# Altium project Ezlo-RF-Switch.PrjPcb
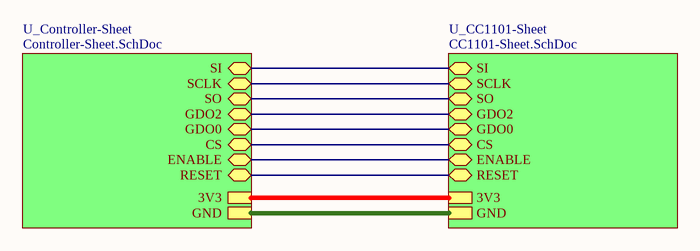
[diagram p0: Top-Sheet.SchDoc]
3 sheets, 29 parts. Net scope: hierarchical (ports join the sheet entries above them; power ports are global).
Sheets:
  Top-Sheet.SchDoc
    U_Controller-Sheet = Controller-Sheet.SchDoc
    U_CC1101-Sheet = CC1101-Sheet.SchDoc

## Sheet Top-Sheet.SchDoc
size A4; SheetNumber: 1; SheetTotal: 3

### Sub-sheets
U_CC1101-Sheet = CC1101-Sheet.SchDoc: SI (bidir), SCLK (bidir), SO (bidir), GDO2 (bidir), GDO0 (bidir), CS (bidir), ENABLE (bidir), RESET (bidir), 3V3, GND
U_Controller-Sheet = Controller-Sheet.SchDoc: SI (bidir), SCLK (bidir), SO (bidir), GDO2 (bidir), GDO0 (bidir), CS (bidir), ENABLE (bidir), RESET (bidir), 3V3, GND

### Nets
3V3: sheet U_Controller-Sheet/3V3, sheet U_CC1101-Sheet/3V3
GND: sheet U_Controller-Sheet/GND, sheet U_CC1101-Sheet/GND
CS: sheet U_Controller-Sheet/CS, sheet U_CC1101-Sheet/CS
ENABLE: sheet U_Controller-Sheet/ENABLE, sheet U_CC1101-Sheet/ENABLE
GDO0: sheet U_Controller-Sheet/GDO0, sheet U_CC1101-Sheet/GDO0
GDO2: sheet U_Controller-Sheet/GDO2, sheet U_CC1101-Sheet/GDO2
RESET: sheet U_Controller-Sheet/RESET, sheet U_CC1101-Sheet/RESET
SCLK: sheet U_Controller-Sheet/SCLK, sheet U_CC1101-Sheet/SCLK
SI: sheet U_Controller-Sheet/SI, sheet U_CC1101-Sheet/SI
SO: sheet U_Controller-Sheet/SO, sheet U_CC1101-Sheet/SO

### Notes on the sheet
- File:
- Title:
- Date:
- Page
- Num:
- Total:
- Drawn By: Huzaifa Ali

## Sheet Controller-Sheet.SchDoc
size A4; SheetNumber: 2; SheetTotal: 3
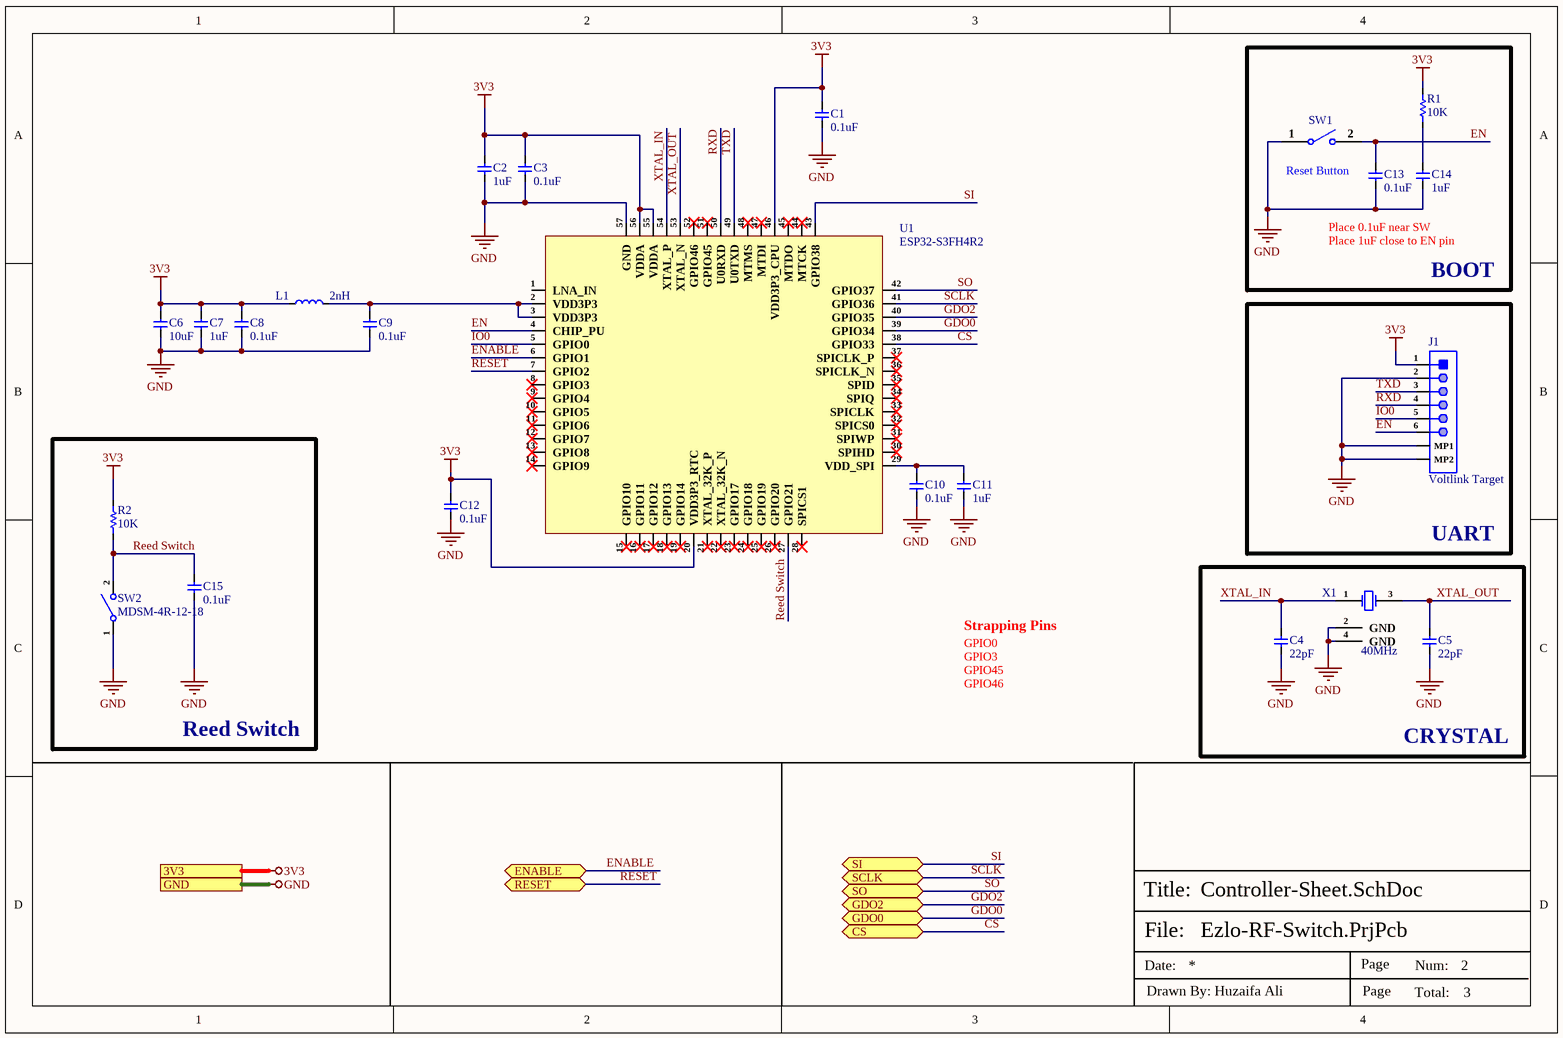
[diagram p1: Controller-Sheet.SchDoc]

### Parts
C1  0.1uF  [CAP-0201]
C2  1uF  [CAP-0201]
C3  0.1uF  [CAP-0201]
C4  22pF  [CAP-0201]
C5  22pF  [CAP-0201]
C6  10uF  [Cap-0603]
C7  1uF  [CAP-0201]
C8  0.1uF  [CAP-0201]
C9  0.1uF  [CAP-0201]
C10  0.1uF  [CAP-0201]
C11  1uF  [CAP-0201]
C12  0.1uF  [CAP-0201]
C13  0.1uF  [CAP-0201]
C14  1uF  [CAP-0201]
C15  0.1uF  [CAP-0201]
J1  Voltlink Target  [Voltlink Target]
L1  2nH  [IND-0201]
R1  10K  [Res-0201]
R2  10K  [Res-0201]
SW1  B3U-1000P  [B3U-1000P]  (value not drawn)
SW2  MDSM-4R-12-18  [MDSM-4R-12-18]
U1  ESP32-S3FH4R2  [QFNWB-56 (7×7)]
X1  40MHz  [X322540MPB4SI_]

### Blocks framed on the sheet
BOOT: C13 C14 R1 SW1
UART: J1
Reed Switch: C15 R2 SW2
CRYSTAL: C4 C5 X1

### Ports
3V3 (see Top-Sheet[2C], CC1101-Sheet[1D]), CS (bidir, see Top-Sheet[2B], CC1101-Sheet[3D]), ENABLE (bidir, see Top-Sheet[2B], CC1101-Sheet[2D]), GDO0 (bidir, see Top-Sheet[2B], CC1101-Sheet[3D]), GDO2 (bidir, see Top-Sheet[2B], CC1101-Sheet[3D]), GND (see Top-Sheet[2C], CC1101-Sheet[1D]), RESET (bidir, see Top-Sheet[2B], CC1101-Sheet[2D]), SCLK (bidir, see Top-Sheet[2B], CC1101-Sheet[3D]), SI (bidir, see Top-Sheet[2B], CC1101-Sheet[3D]), SO (bidir, see Top-Sheet[2B], CC1101-Sheet[3D])

### Nets
3V3: C1.2 C2.2 C3.2 C6.2 C7.2 C8.2 C12.2 J1.1 L1.1 R1.2 R2.2 U1.20(VDD3P3_RTC) U1.46(VDD3P3_CPU) U1.55(VDDA) U1.56(VDDA) ; port 3V3
GND: C1.1 C2.1 C3.1 C4.1 C5.1 C6.1 C7.1 C8.1 C9.1 C10.1 C11.1 C12.1 C13.1 C14.1 C15.1 J1.2 J1.MP1 J1.MP2 SW1.1 SW2.1 U1.57(GND) X1.2(GND) X1.4(GND) ; port GND
CS: U1.38(GPIO33) ; port CS
EN: C13.2 J1.6 SW1.2 U1.4(CHIP_PU)
ENABLE: U1.6(GPIO1) ; port ENABLE
GDO0: U1.39(GPIO34) ; port GDO0
GDO2: U1.40(GPIO35) ; port GDO2
IO0: J1.5 U1.5(GPIO0)
Reed Switch: C15.2 R2.1 SW2.2 U1.27(GPIO21)
RESET: U1.7(GPIO2) ; port RESET
RXD: J1.4 U1.50(U0RXD)
SCLK: U1.41(GPIO36) ; port SCLK
SI: U1.43(GPIO38) ; port SI
SO: U1.42(GPIO37) ; port SO
TXD: J1.3 U1.49(U0TXD)
XTAL_IN: C4.2 U1.54(XTAL_P) X1.1(CRYSTAL)
XTAL_OUT: C5.2 U1.53(XTAL_N) X1.3(CRYSTAL)
NetC9_2: C9.2 L1.2 U1.2(VDD3P3) U1.3(VDD3P3)
NetC10_2: C10.2 C11.2 U1.29(VDD_SPI)
NetC14_2: C14.2 R1.1

Not connected (* = marked no-connect by the designer): U1 1(LNA_IN) 8(GPIO3)* 9(GPIO4)* 10(GPIO5)* 11(GPIO6)* 12(GPIO7)* 13(GPIO8)* 14(GPIO9)* 15(GPIO10)* 16(GPIO11)* 17(GPIO12)* 18(GPIO13)* 19(GPIO14)* 21(XTAL_32K_P)* 22(XTAL_32K_N)* 23(GPIO17)* 24(GPIO18)* 25(GPIO19)* 26(GPIO20)* 28(SPICS1)* 30(SPIHD)* 31(SPIWP)* 32(SPICS0)* 33(SPICLK)* 34(SPIQ)* 35(SPID)* 36(SPICLK_N)* 37(SPICLK_P)* 44(MTCK)* 45(MTDO)* 47(MTDI)* 48(MTMS)* 51(GPIO45)* 52(GPIO46)*

### Notes on the sheet
- Reset Button
- Place 1uF close to EN pin
- Place 0.1uF near SW
- Strapping Pins
- GPIO0
  GPIO3
  GPIO45
  GPIO46
- File:
- Title:
- Date:
- Page
- Num:
- Total:
- Drawn By: Huzaifa Ali

### Library data of the parts
C1 C3 C8-C10 C12 C13 C15 = GRM033R61E104KE14D: CAP CER 0.1UF 25V X5R 0201; Manufacturer: Murata; Tolerance: 10%; Item Type: Capacitor; Material: 4241ConductorMaterial; Value: 100nF; Manufacturer Part Number: GRM033R61E104KE14D; RoHS: Yes; Category: Ceramic Capacitors; Case/Package: 0201; Case Code (Metric): 0603; Case Code (Imperial): 0201; Weight: 1.2E-05oz; Min Operating Temperature: -55°C; Max Operating Temperature: 85°C; Packaging: Tape and Reel; Voltage Rating: 25V; Dielectric: X5R; Termination: SMD/SMT; Voltage Rating (DC): 25V; Package Quantity: 15000; Series: GRM; Length: 0.024inch; Width: 0.012inch; Height: 0.3mm; Thickness: 0.013inch; Lead Free: Lead Free; RoHS Compliant: Yes; ComponentLink1URL: http://www.farnell.com/datasheets/2867843.pdf?src-supplier=Farnell; ComponentLink1Description: http://www.farnell.com/datasheets/2867843.pdf?src-supplier=Farnell; ComponentLink2URL: http://www.mouser.com/ds/2/281/c02e-2905.pdf?src-supplier=Mouser; ComponentLink2Description: http://www.mouser.com/ds/2/281/c02e-2905.pdf?src-supplier=Mouser; ComponentLink3URL: https://datasheet.octopart.com/GRM033R61E104KE14D-Murata-datasheet-22122223.pdf?src-supplier=Future+Electronics; ComponentLink3Description: https://datasheet.octopart.com/GRM033R61E104KE14D-Murata-datasheet-22122223.pdf?src-supplier=Future+Electronics; ComponentLink4URL: http://www.farnell.com/datasheets/2867843.pdf?src-supplier=Element14; ComponentLink4Description: http://www.farnell.com/datasheets/2867843.pdf?src-supplier=Element14; ComponentLink5URL: http://search.murata.co.jp/Ceramy/image/img/A01X/G101/ENG/GRM033R61E104KE14-01.pdf?src-supplier=Digi-Key; ComponentLink5Description: http://search.murata.co.jp/Ceramy/image/img/A01X/G101/ENG/GRM033R61E104KE14-01.pdf?src-supplier=Digi-Key; LCSC Part Number: C76939; Supplier: Rs; Supplier Part Number: 1852066; Stock: 14000; Pricing: 1000=0.008, 5000=0.007, 10000=0.006 (GBP); Mounting Technology: Surface Mount; ComponentLink6URL: http://www.farnell.com/datasheets/2867843.pdf?src-supplier=Newark; ComponentLink6Description: http://www.farnell.com/datasheets/2867843.pdf?src-supplier=Newark; ComponentLink7URL: https://datasheet.octopart.com/GRM033R61E104KE14D-Murata-datasheet-165579666.pdf?src-supplier=TME; ComponentLink7Description: https://datasheet.octopart.com/GRM033R61E104KE14D-Murata-datasheet-165579666.pdf?src-supplier=TME
C2 C7 C11 C14 = GRM033R61C105ME15D: CAP CER 1UF 16V X5R 0201; Manufacturer: Murata; Item Type: Capacitor; Supplier 1: Digi-Key; Manufacturer Part Number: GRM033R61C105ME15D; Stock 1: 12823; Pricing 1: 1=0.14, 10=0.098, 50=0.0554, 100=0.0459, 500=0.0322, 1000=0.02665, 2500=0.02481, 5000=0.0227 (USD); ComponentLink1URL: https://datasheet.octopart.com/GRM033R61C105ME15D-Murata-datasheet-155345049.pdf?src-supplier=Element14; ComponentLink1Description: https://datasheet.octopart.com/GRM033R61C105ME15D-Murata-datasheet-155345049.pdf?src-supplier=Element14; Supplier Part Number 1: 490-18654-1-ND; LCSC Part Number: C335102; RoHS: No; Category: Ceramic Capacitors; ComponentLink2URL: https://datasheet.octopart.com/GRM033R61C105ME15D-Murata-datasheet-165579666.pdf?src-supplier=TME; ComponentLink2Description: https://datasheet.octopart.com/GRM033R61C105ME15D-Murata-datasheet-165579666.pdf?src-supplier=TME
C4 C5 = GRM0335C1H220JA01D: CAP CER 22PF 50V C0G/NP0 0201; Manufacturer: Murata; Tolerance: 5%; Dielectric: C0G; Temperature Coefficient: 30ppm/°C; Item Type: Capacitor; Material: 4241ConductorMaterial; Manufacturer Part Number: GRM0335C1H220JA01D; RoHS: Yes; Category: Ceramic Capacitors; Mounting Technology: Surface Mount; Case/Package: 0201; Case Code (Metric): 0603; Case Code (Imperial): 0201; Min Operating Temperature: -55°C; Max Operating Temperature: 125°C; Value: 22pF; Voltage Rating: 50V; Packaging: Tape and Reel; Package Quantity: 1; Voltage Rating (DC): 50V; Termination: SMD/SMT; Voltage: 50V; Series: GRM; Length: 0.024inch; Width: 0.012inch; Height: 0.3mm; Depth: 0.3mm; Lead Free: Lead Free; RoHS Compliant: Yes; ComponentLink1URL: https://datasheet.ciiva.com/6271/partnumbering-e-01-6271146.pdf?src-supplier=Digi-Key; ComponentLink1Description: https://datasheet.ciiva.com/6271/partnumbering-e-01-6271146.pdf?src-supplier=Digi-Key; ComponentLink2URL: https://datasheet.ciiva.com/6271/partnumbering-e-01-6271143.pdf?src-supplier=Digi-Key; ComponentLink2Description: https://datasheet.ciiva.com/6271/partnumbering-e-01-6271143.pdf?src-supplier=Digi-Key; ComponentLink3URL: https://datasheet.ciiva.com/6271/partnumbering-e-01-6271149.pdf?src-supplier=Digi-Key; ComponentLink3Description: https://datasheet.ciiva.com/6271/partnumbering-e-01-6271149.pdf?src-supplier=Digi-Key; LCSC Part Number: C76924; Supplier: Rs; Supplier Part Number: 8202728; Stock: 9500; Pricing: 500=0.004, 5000=0.003, 12500=0.002, 50000=0.002 (GBP)
C6 = GRM188R6YA106MA73D: 10uF 35V X5R 20% Pad SMD 0603; Manufacturer: Murata; Supplier 1: Arrow Electronics; Manufacturer Part Number: GRM188R6YA106MA73D; RoHS: Yes; Category: Ceramic Capacitors; Stock 1: 37601; Pricing 1: 1=0.36650, 10=0.23380, 25=0.23160, 100=0.15050, 250=0.14890, 500=0.10700, 1000=0.09270, 3000=0.08640, 6000=0.07720, 15000=0.07140, 30000=0.05840 (USD); Mount: Surface Mount; Case/Package: 0603; Case Code (Metric): 1608; Case Code (Imperial): 0603; Min Operating Temperature: -55°C; Max Operating Temperature: 85°C; Packaging: Tape and Reel; Capacitance: 10uF; Voltage Rating: 35V; Tolerance: 20%; Voltage Rating (DC): 35V; Dielectric: X5R; Length: 0.063inch; Width: 0.031inch; Thickness: 0.039inch; RoHS Compliant: Yes; ComponentLink1URL: http://search.murata.co.jp/Ceramy/image/img/A01X/G101/ENG/GRM188R6YA106MA73-01.pdf?src-supplier=Future+Electronics; ComponentLink1Description: http://search.murata.co.jp/Ceramy/image/img/A01X/G101/ENG/GRM188R6YA106MA73-01.pdf?src-supplier=Future+Electronics; ComponentLink2URL: http://search.murata.co.jp/Ceramy/image/img/A01X/G101/ENG/GRM188R6YA106MA73-01.pdf?src-supplier=Digi-Key; ComponentLink2Description: http://search.murata.co.jp/Ceramy/image/img/A01X/G101/ENG/GRM188R6YA106MA73-01.pdf?src-supplier=Digi-Key; ComponentLink3URL: https://www.murata.com/~/media/webrenewal/support/library/catalog/products/capacitor/mlcc/c02e.ashx?la=en-us&src-supplier=Digi-Key; ComponentLink3Description: https://www.murata.com/~/media/webrenewal/support/library/catalog/products/capacitor/mlcc/c02e.ashx?la=en-us&src-supplier=Digi-Key; ComponentLink4URL: http://search.murata.co.jp/Ceramy/image/img/A01X/G101/ENG/GRM188R6YA106MA73-01.pdf?src-supplier=Mouser; ComponentLink4Description: http://search.murata.co.jp/Ceramy/image/img/A01X/G101/ENG/GRM188R6YA106MA73-01.pdf?src-supplier=Mouser; ComponentLink5URL: http://search.murata.co.jp/Ceramy/image/img/A01X/G101/ENG/GRM188R6YA106MA73-01.pdf?src-supplier=TTI; ComponentLink5Description: http://search.murata.co.jp/Ceramy/image/img/A01X/G101/ENG/GRM188R6YA106MA73-01.pdf?src-supplier=TTI; Supplier Part Number 1: GRM188R6YA106MA73D; LCSC Part Number: C194427
J1 = C145963: 1x6P SH 1 1mm 6 SMD,P=1mm Wire To Board / Wire To Wire Connector ROHS; Manufacturer: BOOMELE; Manufacturer Part Number: C145963; Package: SMD,P=1mm; LCSC Part Number: C145963; Item Type: Connector; ComponentLink1Description: LCSC; ComponentLink1URL: https://www.lcsc.com/product-detail/Wire-To-Board-Wire-To-Wire-Connector_BOOMELE-Boom-Precision-Elec-C145963_C145963.html
L1 = MLG0603P2N0CT000: FIXED IND 2NH 600MA 100 MOHM SMD; Manufacturer: TDK; Item Type: Inductor; Core Material: Non-Magnetic; Shielding: Unshielded; DC Resistance (DCR): 100mR; Self Resonant Frequency: 8.5GHz; Test Frequency: 500MHz; Supplier: Digi-Key; Supplier Part Number: 445-172431-1-ND; Manufacturer Part Number: MLG0603P2N0CT000; RoHS: Yes; Category: Fixed Inductors; Stock: 23499; Pricing: 1=0.13, 10=0.118, 25=0.1, 50=0.0882, 100=0.0808, 250=0.07352, 500=0.06908, 1000=0.05292, 2500=0.04998 (USD); ComponentLink1URL: https://datasheet.ciiva.com/41860/inductor-commercial-high-frequency-mlg-qp-en-41860968.pdf?src-supplier=Digi-Key; ComponentLink1Description: https://datasheet.ciiva.com/41860/inductor-commercial-high-frequency-mlg-qp-en-41860968.pdf?src-supplier=Digi-Key; LCSC Part Number: C531323; Mounting Technology: Surface Mount; Case/Package: 0201; Case Code (Metric): 0603; Case Code (Imperial): 0201; Min Operating Temperature: -55°C; Max Operating Temperature: 125°C; Package Quantity: 15000; Packaging: Cut Tape; Current Rating: 600mA; Value: 2nH; Series: MLG-P; Length: 0.024inch; Width: 0.012inch; Height - Seated (Max): 0.013inch; RoHS Compliant: Yes
R1 R2 = RC0201FR-0710KL: RES SMD 10K OHM 1% 1/20W 0201; Manufacturer: Yageo; Item Type: Resistor; Manufacturer Part Number: RC0201FR-0710KL; Package: 0201; ComponentLink7Description: LCSC; ComponentLink7URL: https://www.lcsc.com/product-detail/Chip-Resistor-Surface-Mount_YAGEO-RC0201FR-0710KL_C106225.html; LCSC Part Number: C106225
SW1 = B3U-1000P: SWITCH TACTILE SPST-NO 0.05A 12V; Manufacturer: Omron; Mechanical Life: 200000Cycles; Operating Force: 1.5N; Throw Configuration: SPST; Current Rating: 50mA; Contact Resistance: 100mR; Illumination Type: Non-Illuminated,Illuminated; Switch Travel: 0.15mm; Switch Function: Off-Mom; Actuator Type: Standard; Actuator Length: 0.4mm; Ratings: Dust Proof,IP40; ComponentLink1URL: http://www.farnell.com/datasheets/60838.pdf?src-supplier=Farnell; ComponentLink1Description: http://www.farnell.com/datasheets/60838.pdf?src-supplier=Farnell; ComponentLink2URL: http://www.farnell.com/datasheets/60838.pdf?src-supplier=Element14; ComponentLink2Description: http://www.farnell.com/datasheets/60838.pdf?src-supplier=Element14; ComponentLink3URL: https://omronfs.omron.com/en_US/ecb/products/pdf/en-b3u.pdf?src-supplier=Digi-Key; ComponentLink3Description: https://omronfs.omron.com/en_US/ecb/products/pdf/en-b3u.pdf?src-supplier=Digi-Key; ComponentLink4URL: http://www.omron.com/ecb/products/pdf/en-b3u.pdf?src-supplier=Digi-Key; ComponentLink4Description: http://www.omron.com/ecb/products/pdf/en-b3u.pdf?src-supplier=Digi-Key; ComponentLink5URL: https://www.distrelec.biz/Web/Downloads/he/et/B3U_eng_datasheet.pdf?mime=application%2Fpdf&src-supplier=Distrelec; ComponentLink5Description: https://www.distrelec.biz/Web/Downloads/he/et/B3U_eng_datasheet.pdf?mime=application%2Fpdf&src-supplier=Distrelec; ComponentLink6URL: http://www.onlinecomponents.com/productFiles/mf-OM/en-b3u.pdf?src-supplier=Onlinecomponents.com; ComponentLink6Description: http://www.onlinecomponents.com/productFiles/mf-OM/en-b3u.pdf?src-supplier=Onlinecomponents.com; Supplier 1: Digi-Key; Manufacturer Part Number: B3U-1000P; Stock 1: 116454; Pricing 1: 1=1, 10=0.961, 25=0.9064, 50=0.7976, 100=0.7251, 250=0.68888, 500=0.67074, 1000=0.52571 (USD); Mount: Surface Mount; Weight: 0.000776oz; Contact Material: Silver; Min Operating Temperature: -25°C; Max Operating Temperature: 70°C; Packaging: Tape and Reel; Voltage Rating (DC): 12V; Package Quantity: 1; Max Current Rating: 50mA; Termination: SMD/SMT; Orientation: Straight; Max Voltage Rating (DC): 12V; Electrical Life: 200000Cycles; Insulation Resistance: 100MR; Contact Current Rating: 50mA; Length: 4mm; Height: 1.2mm; Depth: 2.5mm; Width: 3mm; REACH SVHC: Unknown; Lead Free: Lead Free; ComponentLink7URL: https://www.verical.com/server-webapp/html/getDatasheet?partID=552554&src-supplier=Verical; ComponentLink7Description: https://www.verical.com/server-webapp/html/getDatasheet?partID=552554&src-supplier=Verical; ComponentLink8URL: http://www.farnell.com/datasheets/1685550.pdf?src-supplier=Element14; ComponentLink8Description: http://www.farnell.com/datasheets/1685550.pdf?src-supplier=Element14; ComponentLink9URL: http://www.farnell.com/datasheets/2610940.pdf?src-supplier=Farnell; ComponentLink9Description: http://www.farnell.com/datasheets/2610940.pdf?src-supplier=Farnell; ComponentLink10URL: https://www.alliedelec.com/m/d/4c8a9ef82804fc3c241a13c1e298fd73.pdf?src-supplier=Allied+Electronics; ComponentLink10Description: https://www.alliedelec.com/m/d/4c8a9ef82804fc3c241a13c1e298fd73.pdf?src-supplier=Allied+Electronics; Supplier Part Number 1: SW1020DKR-ND; LCSC Part Number: C231329; Item Type: Switch
SW2 = MDSM-4R-12-18: SWITCH REED SPST-NO 350MA 140V; Manufacturer: Littelfuse; Contact Current Rating: 500mA; Supplier: Digi-Key; Supplier Part Number: HE151CT-ND; Manufacturer Part Number: MDSM-4R-12-18; RoHS: Yes; Category: Switches; Stock: 229031; Pricing: 1=0.97, 10=0.932, 25=0.8712, 100=0.7565, 250=0.6884, 500=0.6603 (USD); Pins: 2NUMBER; Height: 2.84mm; ComponentLink1URL: https://datasheet.ciiva.com/26852/getdatasheetpartid-422080-26852456.pdf?src-supplier=Verical; ComponentLink1Description: https://datasheet.ciiva.com/26852/getdatasheetpartid-422080-26852456.pdf?src-supplier=Verical; ComponentLink2URL: https://datasheet.ciiva.com/16451/mdsm-4-16451549.pdf?src-supplier=Future+Electronics; ComponentLink2Description: https://datasheet.ciiva.com/16451/mdsm-4-16451549.pdf?src-supplier=Future+Electronics; ComponentLink3URL: https://datasheet.ciiva.com/29124/mdsm-4r-29124540.pdf?src-supplier=Digi-Key; ComponentLink3Description: https://datasheet.ciiva.com/29124/mdsm-4r-29124540.pdf?src-supplier=Digi-Key; ComponentLink4URL: https://datasheet.ciiva.com/29124/mdsm-4r-29124541.pdf?src-supplier=Digi-Key; ComponentLink4Description: https://datasheet.ciiva.com/29124/mdsm-4r-29124541.pdf?src-supplier=Digi-Key; ComponentLink5URL: https://datasheet.ciiva.com/29124/mdsm-4r-29124542.pdf?src-supplier=Digi-Key; ComponentLink5Description: https://datasheet.ciiva.com/29124/mdsm-4r-29124542.pdf?src-supplier=Digi-Key
U1 = ESP32-S3FH4R2: 21dBm ESP32-S3R8 2.4GHz SMD WiFi Modules ROHS; Manufacturer: Espressif Systems; Item Type: IC; Supplier: Mouser; Supplier Part Number: 356-ESP32-S3FH4R2; Manufacturer Part Number: ESP32-S3FH4R2; RoHS: No; Stock: 2650; Pricing: 1=2.32, 10=2.32, 50=2.32, 100=2.32, 1000=2.32, 10000=2.32 (USD); LCSC Part Number: C3013940; ComponentLink1Description: LCSC; ComponentLink1URL: https://www.lcsc.com/product-detail/WiFi-Modules_Espressif-Systems-ESP32-S3FH4R2_C3013940.html
X1 = X322540MPB4SI: 40MHz SMD Crystal Resonator 15pF SMD3225-4P Crystals ROHS; Manufacturer: Yangxing Tech; Manufacturer Part Number: X322540MPB4SI; Value: 40MHZ; LCSC Part Number: C9010; ComponentLink1Description: LCSC; ComponentLink1URL: https://www.lcsc.com/product-detail/Crystals_Yangxing-Tech-X322540MPB4SI_C9010.html; Item Type: Crystal

## Sheet CC1101-Sheet.SchDoc
size A4; SheetNumber: 3; SheetTotal: 3
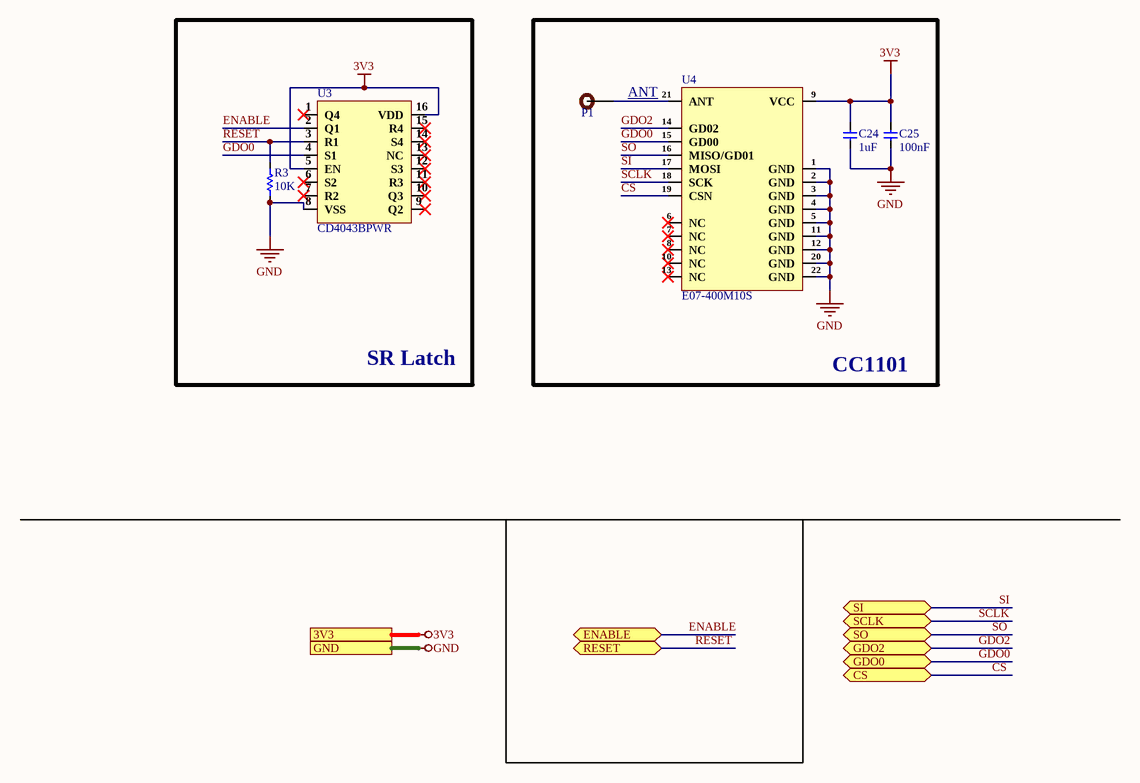
[diagram p2: CC1101-Sheet.SchDoc]

### Parts
C24  1uF  [Cap-0201]
C25  100nF  [Cap-0201]
P1  TEST POINT  [Test-point]  (value not drawn)
R3  10K  [Res-0201]
U3  CD4043BPWR  [TSSOP_16]
U4  E07-400M10S  [E07-400M10S]

### Blocks framed on the sheet
SR Latch: R3 U3
CC1101: C24 C25 P1 U4

### Ports
3V3 (see Top-Sheet[2C], Controller-Sheet[1D]), CS (bidir, see Top-Sheet[2B], Controller-Sheet[3D]), ENABLE (bidir, see Top-Sheet[2B], Controller-Sheet[2D]), GDO0 (bidir, see Top-Sheet[2B], Controller-Sheet[3D]), GDO2 (bidir, see Top-Sheet[2B], Controller-Sheet[3D]), GND (see Top-Sheet[2C], Controller-Sheet[1D]), RESET (bidir, see Top-Sheet[2B], Controller-Sheet[2D]), SCLK (bidir, see Top-Sheet[2B], Controller-Sheet[3D]), SI (bidir, see Top-Sheet[2B], Controller-Sheet[3D]), SO (bidir, see Top-Sheet[2B], Controller-Sheet[3D])

### Nets
3V3: C24.2 C25.2 U3.5(EN) U3.16(VDD) U4.9(VCC) ; port 3V3
GND: C24.1 C25.1 R3.1 U3.8(VSS) U4.1(GND) U4.2(GND) U4.3(GND) U4.4(GND) U4.5(GND) U4.11(GND) U4.12(GND) U4.20(GND) U4.22(GND) ; port GND
CS: U4.19(CSN) ; port CS
ENABLE: U3.2(Q1) ; port ENABLE
GDO0: U3.4(S1) U4.15(GD00) ; port GDO0
GDO2: U4.14(GD02) ; port GDO2
RESET: R3.2 U3.3(R1) ; port RESET
SCLK: U4.18(SCK) ; port SCLK
SI: U4.17(MOSI) ; port SI
SO: U4.16(MISO/GD01) ; port SO
NetP1_1: P1.1 U4.21(ANT)

Not connected (* = marked no-connect by the designer): U3 1(Q4)* 6(S2)* 7(R2)* 9(Q2)* 10(Q3)* 11(R3)* 12(S3)* 13(NC)* 14(S4)* 15(R4)*; U4 6(NC)* 7(NC)* 8(NC)* 10(NC)* 13(NC)*

### Notes on the sheet
- ANT <Add 10pF cap here>
- File:
- Title:
- Date:
- Page
- Num:
- Total:
- Drawn By: Huzaifa Ali

### Library data of the parts
C24 = CC0201KRX5R5BB105: CAP CER 1UF 6.3V X5R 0201; Manufacturer: Yageo; Tolerance: 10%; Item Type: Capacitor; Supplier 1: Arrow Electronics; Manufacturer Part Number: CC0201KRX5R5BB105; RoHS: Yes; Category: Ceramic Capacitors; Stock 1: 600000; Pricing 1: 15000=0.00740 (USD); Mount: Surface Mount; Case/Package: 0201; Case Code (Imperial): 0201; Case Code (Metric): 0603; Min Operating Temperature: -55°C; Max Operating Temperature: 85°C; Packaging: Cut Tape; Capacitance: 1uF; Voltage Rating: 6.3V; RoHS Compliant: Yes; ComponentLink1URL: http://www.yageo.com/documents/recent/UPY-GPHC_X5R_4V-to-50V_25.pdf?src-supplier=Digi-Key; ComponentLink1Description: http://www.yageo.com/documents/recent/UPY-GPHC_X5R_4V-to-50V_25.pdf?src-supplier=Digi-Key; ComponentLink2URL: https://www.yageo.com/upload/media/product/productsearch/datasheet/mlcc/UPY-GPHC_X5R_4V-to-50V_26.pdf?src-supplier=Digi-Key; ComponentLink2Description: https://www.yageo.com/upload/media/product/productsearch/datasheet/mlcc/UPY-GPHC_X5R_4V-to-50V_26.pdf?src-supplier=Digi-Key; Supplier Part Number 1: CC0201KRX5R5BB105; LCSC Part Number: C541330
C25 = CC0201KRX5R5BB104: CAP CER 0.1UF 6.3V X5R 0201; Manufacturer: Yageo; Tolerance: 10%; Supplier 1: Avnet; Manufacturer Part Number: CC0201KRX5R5BB104; RoHS: Yes; Category: Ceramic Capacitors; Stock 1: 1290000; Pricing 1: 15000=0.00238 (USD); Mount: Surface Mount; Case/Package: 0201; Number of Pins: 2; Case Code (Imperial): 0201; Case Code (Metric): 0603; Min Operating Temperature: -55°C; Max Operating Temperature: 85°C; Capacitance: 100nF; Dielectric: X5R; Voltage Rating: 6.3V; Packaging: Tape and Reel; Package Quantity: 1; Voltage Rating (DC): 6.3V; Termination: SMD/SMT; Resistor Type: Ceramic; Series: CC; Length: 0.6mm; Width: 0.012inch; Height: 0.3mm; Thickness: 0.013inch; Depth: 0.3mm; Reach SVHC Compliant: Yes; Lead Free: Lead Free; Halogen Free: Halogen Free; RoHS Compliant: Yes; ComponentLink1URL: https://datasheet.ciiva.com/7656/1525783-7656597.pdf?src-supplier=Element14; ComponentLink1Description: https://datasheet.ciiva.com/7656/1525783-7656597.pdf?src-supplier=Element14; ComponentLink2URL: https://datasheet.ciiva.com/28450/1359354-28450200.pdf?src-supplier=Element14; ComponentLink2Description: https://datasheet.ciiva.com/28450/1359354-28450200.pdf?src-supplier=Element14; ComponentLink3URL: https://datasheet.ciiva.com/176/mlccorderingcode-176766.pdf?src-supplier=Digi-Key; ComponentLink3Description: https://datasheet.ciiva.com/176/mlccorderingcode-176766.pdf?src-supplier=Digi-Key; ComponentLink4URL: https://datasheet.ciiva.com/176/mlccorderingcode-176765.pdf?src-supplier=Digi-Key; ComponentLink4Description: https://datasheet.ciiva.com/176/mlccorderingcode-176765.pdf?src-supplier=Digi-Key; ComponentLink5URL: https://datasheet.ciiva.com/176/mlccorderingcode-176767.pdf?src-supplier=Digi-Key; ComponentLink5Description: https://datasheet.ciiva.com/176/mlccorderingcode-176767.pdf?src-supplier=Digi-Key; Supplier Part Number 1: CC0201KRX5R5BB104
P1 = TEST POINT: Test Point ON; Item Type: TEST POINT
R3 = RC0201JR-0710KL: RES SMD 10K OHM 5% 1/20W 0201; Manufacturer: Yageo; Voltage Rating (DC): 25V; Power Rating: 50mW; Resistance: 10kR; Temperature Coefficient: 200ppm/°C; Case Code (Imperial): 0201; Case Code (Metric): 0603; Case/Package: 0201; Category: Chip SMD Resistors; Contact Plating: Tin,Matte; Depth: 0.3mm; Lead Free: Lead Free; Length: 0.6mm; Manufacturer Part Number: RC0201JR-0710KL; Max Operating Temperature: 125°C; Military Standard: Not; Min Operating Temperature: -55°C; Packaging: Tape and Reel; Radiation Hardening: No; REACH SVHC: Unknown; Resistor Type: Thick Film; Termination: SMD/SMT; Tolerance: 5%; Voltage Rating: 25V; ComponentLink1Description: New link; ComponentLink1URL: *; Supplier 1: Digi-Key; RoHS: Yes; Stock 1: 1488597; Pricing 1: 1=0.10000, 10=0.02600, 100=0.01050, 1000=0.00472, 2500=0.00410, 5000=0.00338 (USD); ComponentLink2URL: https://datasheet.ciiva.com/8891/pyu-rc0201-51-rohs-l-8-8891388.pdf?src-supplier=Avnet; ComponentLink2Description: https://datasheet.ciiva.com/8891/pyu-rc0201-51-rohs-l-8-8891388.pdf?src-supplier=Avnet; ComponentLink3URL: https://datasheet.ciiva.com/7672/1563626-7672253.pdf?src-supplier=Element14; ComponentLink3Description: https://datasheet.ciiva.com/7672/1563626-7672253.pdf?src-supplier=Element14; ComponentLink4URL: https://datasheet.ciiva.com/28405/pyu-rc0201-51-rohs-l-8-28405613.pdf?src-supplier=Avnet+Europe; ComponentLink4Description: https://datasheet.ciiva.com/28405/pyu-rc0201-51-rohs-l-8-28405613.pdf?src-supplier=Avnet+Europe; ComponentLink5URL: https://datasheet.ciiva.com/7672/1563626-7672254.pdf?src-supplier=Element14; ComponentLink5Description: https://datasheet.ciiva.com/7672/1563626-7672254.pdf?src-supplier=Element14; ComponentLink6URL: https://datasheet.ciiva.com/7660/1421516-7660810.pdf?src-supplier=Element14; ComponentLink6Description: https://datasheet.ciiva.com/7660/1421516-7660810.pdf?src-supplier=Element14; ComponentLink7URL: https://datasheet.ciiva.com/16856/pyu-rc0201-51-rohs-l-8-16856011.pdf?src-supplier=Avnet+Europe; ComponentLink7Description: https://datasheet.ciiva.com/16856/pyu-rc0201-51-rohs-l-8-16856011.pdf?src-supplier=Avnet+Europe; ComponentLink8URL: https://datasheet.ciiva.com/46391/1421516-46391291.pdf?src-supplier=Element14; ComponentLink8Description: https://datasheet.ciiva.com/46391/1421516-46391291.pdf?src-supplier=Element14; Supplier Part Number 1: 311-10KNCT-ND; LCSC Part Number: C138117
U3 = CD4043BPWR: 16-Bit Transparent D-Type Latch With 3-State Outputs 48-TVSOP -40 to 125; Manufacturer: Texas Instruments; Manufacturer Part Number: SN74LVC16373ADGVR; Item Type: IC; Supplier: Digi-Key; Supplier Part Number: 296-13242-1-ND; RoHS: Yes; Category: Latches and Flip Flops; Stock: 4536; Pricing: 1=1.51, 10=1.353, 25=1.284, 100=1.0546, 250=0.98588, 500=0.87122, 1000=0.68781 (USD); ComponentLink1URL: https://datasheet.ciiva.com/14288/sn74lvc16373a-14288272.pdf?src-supplier=Avnet; ComponentLink1Description: https://datasheet.ciiva.com/14288/sn74lvc16373a-14288272.pdf?src-supplier=Avnet; ComponentLink2URL: https://datasheet.ciiva.com/22746/1840227-22746081.pdf?src-supplier=Element14; ComponentLink2Description: https://datasheet.ciiva.com/22746/1840227-22746081.pdf?src-supplier=Element14; ComponentLink3URL: https://datasheet.ciiva.com/15088/getdatasheetpartid-527425-15088839.pdf?src-supplier=Verical; ComponentLink3Description: https://datasheet.ciiva.com/15088/getdatasheetpartid-527425-15088839.pdf?src-supplier=Verical; ComponentLink4URL: https://datasheet.ciiva.com/1882/sn74lvc16373a-1882418.pdf?src-supplier=Digi-Key; ComponentLink4Description: https://datasheet.ciiva.com/1882/sn74lvc16373a-1882418.pdf?src-supplier=Digi-Key; ComponentLink5URL: https://datasheet.ciiva.com/1882/sn74lvc16373a-1882419.pdf?src-supplier=Digi-Key; ComponentLink5Description: https://datasheet.ciiva.com/1882/sn74lvc16373a-1882419.pdf?src-supplier=Digi-Key; ComponentLink6URL: https://datasheet.ciiva.com/1882/sn74lvc16373a-1882420.pdf?src-supplier=Digi-Key; ComponentLink6Description: https://datasheet.ciiva.com/1882/sn74lvc16373a-1882420.pdf?src-supplier=Digi-Key; ComponentLink7URL: https://datasheet.ciiva.com/1508/1840227-1508576.pdf?src-supplier=Element14; ComponentLink7Description: https://datasheet.ciiva.com/1508/1840227-1508576.pdf?src-supplier=Element14; ComponentLink8URL: https://datasheet.ciiva.com/48704/001075154-da-01-en-ic-trans-sn74lvc16373adgvr-tvsop-48-tid-48704295.pdf?src-supplier=Conrad; ComponentLink8Description: https://datasheet.ciiva.com/48704/001075154-da-01-en-ic-trans-sn74lvc16373adgvr-tvsop-48-tid-48704295.pdf?src-supplier=Conrad; LCSC Part Number: C2652970; ComponentLink9Description: LCSC; ComponentLink9URL: https://www.lcsc.com/product-detail/Latches_Texas-Instruments-CD4043BPWR_C2652970.html
U4 = E07-400M10S: RF Modules ROHS; Manufacturer: Chengdu Ebyte Elec Tech; Item Type: Module; Manufacturer Part Number: E07-400M10S; Package: Custom; LCSC Part Number: C2965513; ComponentLink1Description: LCSC; ComponentLink1URL: https://www.lcsc.com/product-detail/RF-Modules_Chengdu-Ebyte-Elec-Tech-E07-400M10S_C2965513.html

## Nets that join several sheets
3V3: Controller-Sheet (15 pins), CC1101-Sheet (5 pins)
GND: Controller-Sheet (23 pins), CC1101-Sheet (13 pins)
CS: Controller-Sheet (U1.38), CC1101-Sheet (U4.19)
ENABLE: Controller-Sheet (U1.6), CC1101-Sheet (U3.2)
GDO0: Controller-Sheet (U1.39), CC1101-Sheet (U3.4 U4.15)
GDO2: Controller-Sheet (U1.40), CC1101-Sheet (U4.14)
RESET: Controller-Sheet (U1.7), CC1101-Sheet (R3.2 U3.3)
SCLK: Controller-Sheet (U1.41), CC1101-Sheet (U4.18)
SI: Controller-Sheet (U1.43), CC1101-Sheet (U4.17)
SO: Controller-Sheet (U1.42), CC1101-Sheet (U4.16)